# Altium schematic sheet Calibration.SchDoc
size 406 x 304 mm; SheetNumber: 7; SheetTotal: 8
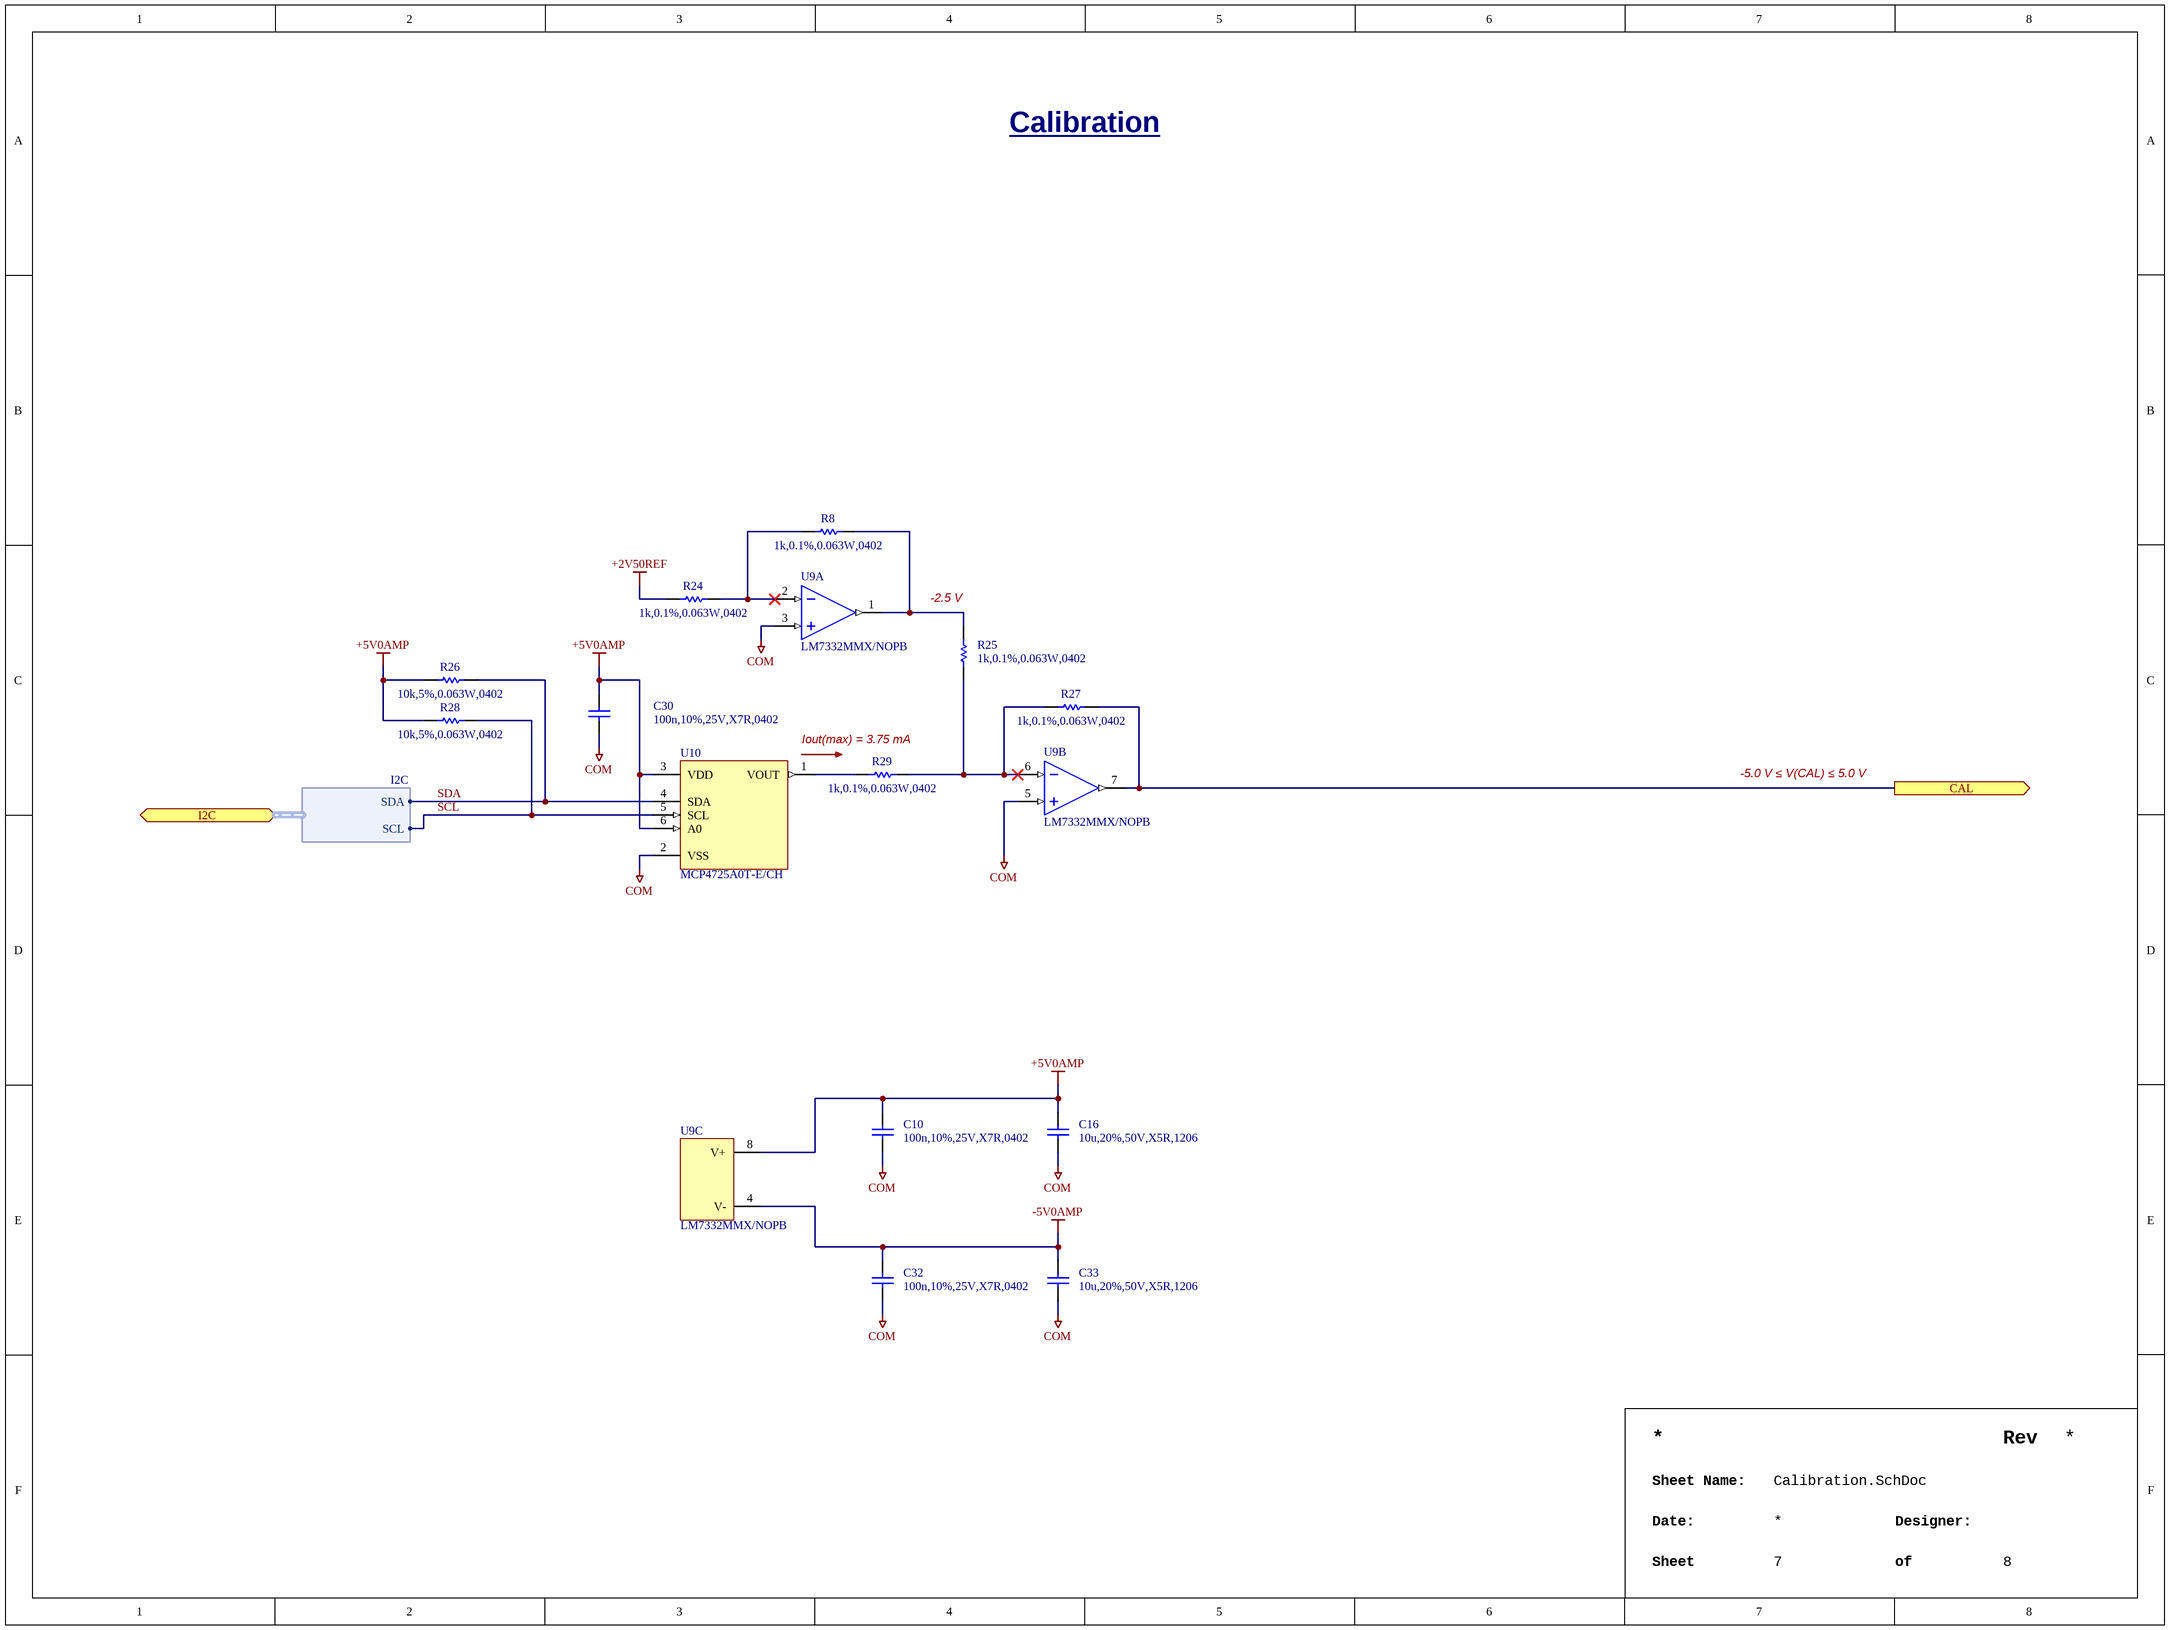
[diagram p0: Calibration.SchDoc]

## Parts
C10  100n,10%,25V,X7R,0402  [CAPC1005X06N]
C16  10u,20%,50V,X5R,1206  [CAPC3216X16N]
C30  100n,10%,25V,X7R,0402  [CAPC1005X06N]
C32  100n,10%,25V,X7R,0402  [CAPC1005X06N]
C33  10u,20%,50V,X5R,1206  [CAPC3216X16N]
R8  1k,0.1%,0.063W,0402  [RESC1005X04N]
R24  1k,0.1%,0.063W,0402  [RESC1005X04N]
R25  1k,0.1%,0.063W,0402  [RESC1005X04N]
R26  10k,5%,0.063W,0402  [RESC1005X04N]
R27  1k,0.1%,0.063W,0402  [RESC1005X04N]
R28  10k,5%,0.063W,0402  [RESC1005X04N]
R29  1k,0.1%,0.063W,0402  [RESC1005X04N]
U9  LM7332MMX/NOPB  [TEXASINSTRUMENTS_PKG_DGK0008A]  (parts A,B,C of 3)
U10  MCP4725A0T-E/CH  [SOTFL95P260X145-6]

## Ports
CAL (out), I2C (bidir, harness I2C)

## Harnesses
I2C: SDA, SCL

## Nets
+2V50REF: R24.1
+5V0AMP: C10.2 C16.2 C30.2 R26.2 R28.2 U9.8(V+) U10.3(VDD) U10.6(A0)
-5V0AMP: C32.2 C33.2 U9.4(V-)
COM: C10.1 C16.1 C30.1 C32.1 C33.1 U9.3(INA+) U9.5(INB+) U10.2(VSS)
CAL: R27.2 U9.7(OUTB) ; port CAL
SCL: R28.1 U10.5(SCL) ; port I2C.SCL
SDA: R26.1 U10.4(SDA) ; port I2C.SDA
NetR8_1: R8.1 R24.2 U9.2(INA-)
NetR8_2: R8.2 R25.1 U9.1(OUTA)
NetR25_2: R25.2 R27.1 R29.2 U9.6(INB-)
NetR29_1: R29.1 U10.1(VOUT)

## Notes on the sheet
- Calibration
- (near R25) -2.5 V
- Iout(max) = 3.75 mA
- -5.0 V ≤ V(CAL) ≤ 5.0 V
- Rev
- Sheet Name:
- Date:
- Sheet
- Designer:
- of

## Library data of the parts
C10 C30 C32 = CAP,Cer,100nF,10%,25V,X7R,0402: 0.1ï¿½F ï¿½10% 25V Ceramic Capacitor X7R 0402 (1005 Metric); Manufacturer 1: Murata Electronics; Manufacturer 1 Part Number: GRM155R71E104KE14J; Vendor 1 Part Number: 490-14603-1-ND; Vendor 1: DigiKey; Value: 100nF; Part Name: CAP,Cer,100nF,10%,25V,X7R,0402; CreatedBy: Judd Foster; HelpURL: https://search.murata.co.jp/Ceramy/image/img/A01X/G101/ENG/GRM155R71E104KE14-01.pdf
C16 C33 = CAP,Cer,10uF,50VDC,X5R,1206: 10ï¿½F ï¿½20% 50V Ceramic Capacitor X5R 1206 (3216 Metric); Manufacturer 1: Samsung Electro-Mechanics; Manufacturer 1 Part Number: CL31A106MBHNNNE; Vendor 1 Part Number: 1276-6736-1-ND; Vendor 1: Digikey; Part Name: CAP,Cer,10uF,50VDC,X5R,1206; CreatedBy: Judd Foster; HelpURL: https://www.samsungsem.com/resources/file/global/support/product_catalog/MLCC.pdf; Value: 10u
R8 R24 R25 R27 R29 = RES,1k,0.1%,0.063W,0402: 1 kOhms Â±0.1% 0.063W, 1/16W Chip Resistor 0402 (1005 Metric) Thin Film; Manufacturer 1: YAGEO; Manufacturer 1 Part Number: RT0402BRE071KL; Vendor 1 Part Number: YAG2306CT-ND; Vendor 1: DigiKey; Part Name: RES,1k,0.1%,0.063W,0402; CreatedBy: Judd Foster; HelpURL: https://www.yageo.com/upload/media/product/app/datasheet/rchip/pyu-rt_1-to-0.01_rohs_l.pdf; Value: 1k
R26 R28 = RES,10k,5%,0.063W,0402: 10 kOhms ï¿½5% 0.063W, 1/16W Chip Resistor 0402 (1005 Metric) Automotive AEC-Q200 Thick Film; Manufacturer 1: Stackpole Electronics Inc; Manufacturer 1 Part Number: RMCF0402JT10K0; Vendor 1 Part Number: RMCF0402JT10K0CT-ND; Vendor 1: DIgikey; Part Name: RES,10k,5%,0.063W,0402; CreatedBy: Judd Foster; HelpURL: https://www.seielect.com/catalog/sei-rmcf_rmcp.pdf; Value: 10k
U9 = LM7332MMX_NOPB: General Purpose Amplifier 2 Circuit Rail-to-Rail 8-VSSOP; Manufacturer 1: Texas Instruments; Vendor 1 Part Number: 296-LM7332MMX/NOPBCT-ND; Vendor 1: DigiKey; Part Name: LM7332MMX_NOPB; CreatedBy: Judd Foster; HelpURL: https://www.ti.com/lit/ds/symlink/lm7332.pdf?HQS=dis-dk-null-digikeymode-dsf-pf-null-wwe&ts=1730932081789&ref_url=https%253A%252F%252Fwww.ti.com%252Fgeneral%252Fdocs%252Fsuppproductinfo.tsp%253FdistId%253D10%2526gotoUrl%253Dhttps%253A%252F%252Fwww.ti.com%; Manufacturer 1 Part Number: LM7332MMX/NOPB
U10 = MCP4725A0T-E/CH: 6us 12 I2C 2.7V~5.5V SOT-23-6 Digital To Analog Converters (DACs) ROHS; Manufacturer 1: Microchip; Vendor 1 Part Number: C144198; Vendor 1: LCSC; Part Name: MCP4725A0T-E/CH; CreatedBy: Judd Foster; HelpURL: https://datasheet.lcsc.com/lcsc/1811151442_Microchip-Tech-MCP4725A0T-E-CH_C144198.pdf; Manufacturer 1 Part Number: MCP4725A0T-E/CH